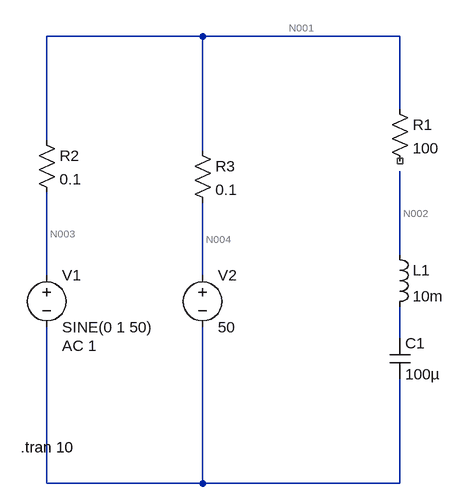
[diagram p0: schematic RLC.asc]
RLC.asc, the LTspice schematic file:
Version 4.1
SHEET 1 932 680
WIRE 368 -64 128 -64
WIRE 672 -64 368 -64
WIRE 672 48 672 -64
WIRE 128 96 128 -64
WIRE 368 112 368 -64
WIRE 672 272 672 144
WIRE 128 304 128 176
WIRE 368 304 368 192
WIRE 672 400 672 352
WIRE 128 624 128 384
WIRE 368 624 368 384
WIRE 368 624 128 624
WIRE 672 624 672 464
WIRE 672 624 368 624
SYMBOL voltage 128 288 R0
WINDOW 123 24 124 Left 2
WINDOW 39 0 0 Left 0
SYMATTR Value2 AC 1
SYMATTR InstName V1
SYMATTR Value SINE(0 1 50)
SYMBOL res 656 32 R0
SYMATTR InstName R1
SYMATTR Value 100
SYMBOL ind 656 256 R0
SYMATTR InstName L1
SYMATTR Value 10m
SYMBOL cap 656 400 R0
SYMATTR InstName C1
SYMATTR Value 100µ
SYMBOL res 112 80 R0
SYMATTR InstName R2
SYMATTR Value 0.1
SYMBOL voltage 368 288 R0
WINDOW 123 0 0 Left 0
WINDOW 39 0 0 Left 0
SYMATTR InstName V2
SYMATTR Value 50
SYMBOL res 352 96 R0
SYMATTR InstName R3
SYMATTR Value 0.1
TEXT 88 568 Left 2 !.tran 10

The netlist it stands for:
* RLC.asc
V1 N003 N006 SINE(0 1 50) AC 1
R1 N001 NC_01 100
L1 N002 N005 10m
C1 N005 N006 100µ
R2 N001 N003 0.1
V2 N004 N006 50
R3 N001 N004 0.1
.tran 10
.backanno
.end

* Results of the author's LTspice run, read from the files saved beside the schematic
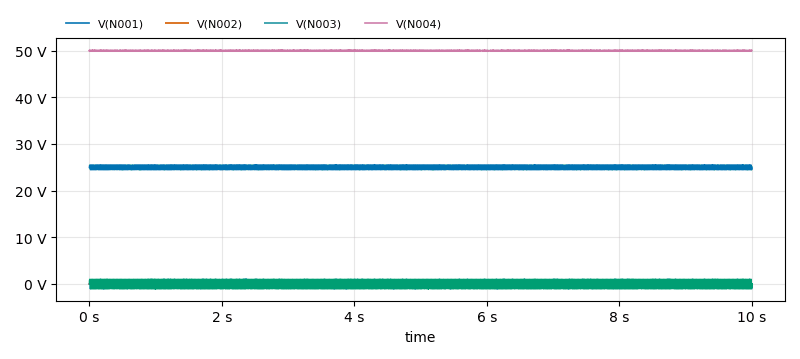
[diagram p1: Transient Analysis of RLC.asc, plotted from the saved traces]
* Transient Analysis, 1 run:
*   V(N001): min 24.45 V, max 25.52 V, average 24.98 V, rms 24.98 V, last 25.02 V
*   V(N002): min -88.48 mV, max 38.61 mV, average -24.68 mV, rms 36.57 mV, last 21.28 mV
*   V(N003): min -1.046 V, max 1.032 V, average -24.68 mV, rms 719.2 mV, last 21.28 mV
*   V(N004): min 49.91 V, max 50.04 V, average 49.98 V, rms 49.98 V, last 50.02 V